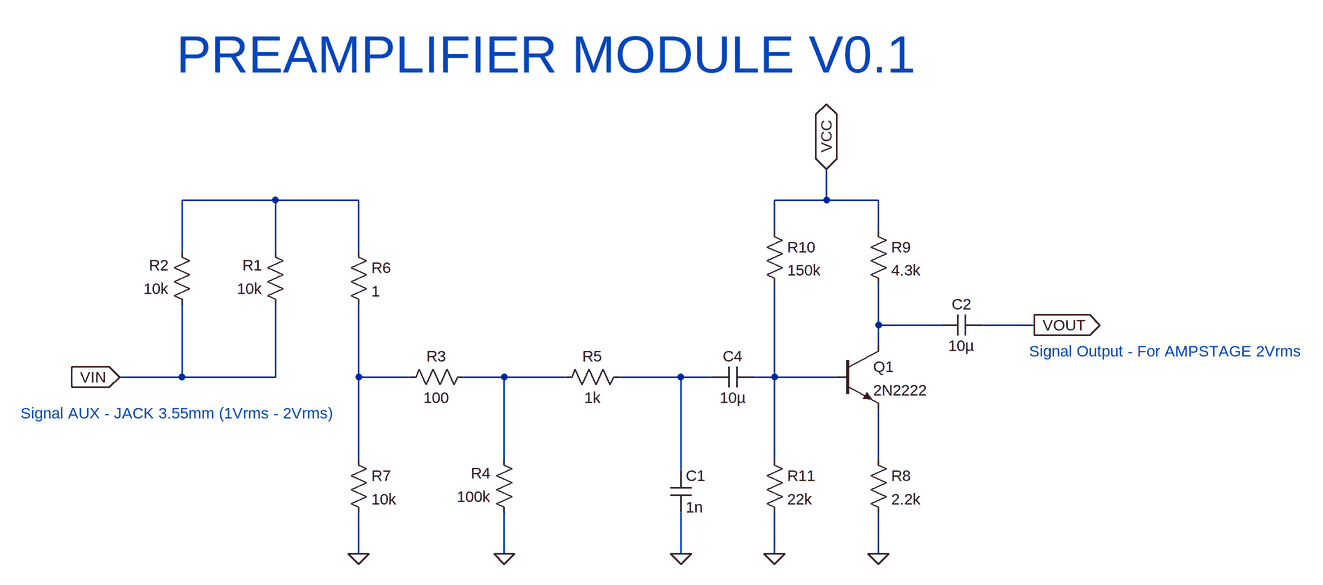
[diagram p0: schematic Preamplificacion_LTspice.asc]
Preamplificacion_LTspice.asc, the LTspice schematic file:
Version 4.1
SHEET 1 1792 768
WIRE 96 112 -48 112
WIRE 224 112 96 112
WIRE 944 112 944 64
WIRE 944 112 864 112
WIRE 1024 112 944 112
WIRE 864 160 864 112
WIRE 1024 160 1024 112
WIRE -48 192 -48 112
WIRE 96 192 96 112
WIRE 224 192 224 112
WIRE 1024 304 1024 240
WIRE 1120 304 1024 304
WIRE 1264 304 1184 304
WIRE 1024 336 1024 304
WIRE -48 384 -48 272
WIRE -48 384 -144 384
WIRE 96 384 96 272
WIRE 96 384 -48 384
WIRE 224 384 224 272
WIRE 304 384 224 384
WIRE 448 384 384 384
WIRE 544 384 448 384
WIRE 720 384 624 384
WIRE 768 384 720 384
WIRE 864 384 864 240
WIRE 864 384 832 384
WIRE 960 384 864 384
WIRE 224 512 224 384
WIRE 448 512 448 384
WIRE 864 512 864 384
WIRE 1024 512 1024 432
WIRE 720 528 720 384
WIRE 224 656 224 592
WIRE 448 656 448 592
WIRE 720 656 720 592
WIRE 864 656 864 592
WIRE 1024 656 1024 592
FLAG 448 656 0
FLAG 720 656 0
FLAG 224 656 0
FLAG 1024 656 0
FLAG 864 656 0
FLAG -144 384 VIN
IOPIN -144 384 In
FLAG 1264 304 VOUT
IOPIN 1264 304 Out
FLAG 944 64 VCC
IOPIN 944 64 BiDir
SYMBOL res 112 288 R180
WINDOW 0 36 76 Left 2
WINDOW 3 36 40 Left 2
SYMATTR InstName R1
SYMATTR Value 10k
SYMBOL res -32 288 R180
WINDOW 0 36 76 Left 2
WINDOW 3 36 40 Left 2
SYMATTR InstName R2
SYMATTR Value 10k
SYMBOL res 400 368 R90
WINDOW 0 0 56 VBottom 2
WINDOW 3 32 56 VTop 2
SYMATTR InstName R3
SYMATTR Value 100
SYMBOL res 464 608 R180
WINDOW 0 36 76 Left 2
WINDOW 3 36 40 Left 2
SYMATTR InstName R4
SYMATTR Value 100k
SYMBOL res 640 368 R90
WINDOW 0 0 56 VBottom 2
WINDOW 3 32 56 VTop 2
SYMATTR InstName R5
SYMATTR Value 1k
SYMBOL cap 704 528 R0
SYMATTR InstName C1
SYMATTR Value 1n
SYMBOL res 208 176 R0
SYMATTR InstName R6
SYMATTR Value 1
SYMBOL res 208 496 R0
SYMATTR InstName R7
SYMATTR Value 10k
SYMBOL npn 960 336 R0
SYMATTR InstName Q1
SYMATTR Value 2N2222
SYMBOL res 1008 496 R0
SYMATTR InstName R8
SYMATTR Value 2.2k
SYMBOL res 1008 144 R0
SYMATTR InstName R9
SYMATTR Value 4.3k
SYMBOL cap 1184 288 R90
WINDOW 0 0 32 VBottom 2
WINDOW 3 32 32 VTop 2
SYMATTR InstName C2
SYMATTR Value 10µ
SYMBOL res 848 144 R0
SYMATTR InstName R10
SYMATTR Value 150k
SYMBOL cap 832 368 R90
WINDOW 0 0 32 VBottom 2
WINDOW 3 32 32 VTop 2
SYMATTR InstName C4
SYMATTR Value 10µ
SYMBOL res 848 496 R0
SYMATTR InstName R11
SYMATTR Value 22k
TEXT -56 -112 Left 6 ;PREAMPLIFIER MODULE V0.1
TEXT -296 440 Left 2 ;Signal AUX - JACK 3.55mm (1Vrms - 2Vrms)
TEXT 1256 344 Left 2 ;Signal Output - For AMPSTAGE 2Vrms

The netlist it stands for:
* Preamplificacion_LTspice.asc
R1 VIN N001 10k
R2 VIN N001 10k
R3 N004 N003 100
R4 0 N004 100k
R5 N005 N004 1k
C1 N005 0 1n
R6 N001 N003 1
R7 N003 0 10k
Q1 N002 N006 N007 0 2N2222
R8 N007 0 2.2k
R9 VCC N002 4.3k
C2 VOUT N002 10µ
R10 VCC N006 150k
C4 N006 N005 10µ
R11 N006 0 22k
.model NPN NPN
.model PNP PNP
.lib standard.bjt
* PREAMPLIFIER MODULE V0.1
* Signal AUX - JACK 3.55mm (1Vrms - 2Vrms)
* Signal Output - For AMPSTAGE 2Vrms
.backanno
.end